# Altium schematic sheet Power-Processor-1-Sheet.SchDoc
size 420 x 297 mm; SheetNumber: 1; SheetTotal: 4
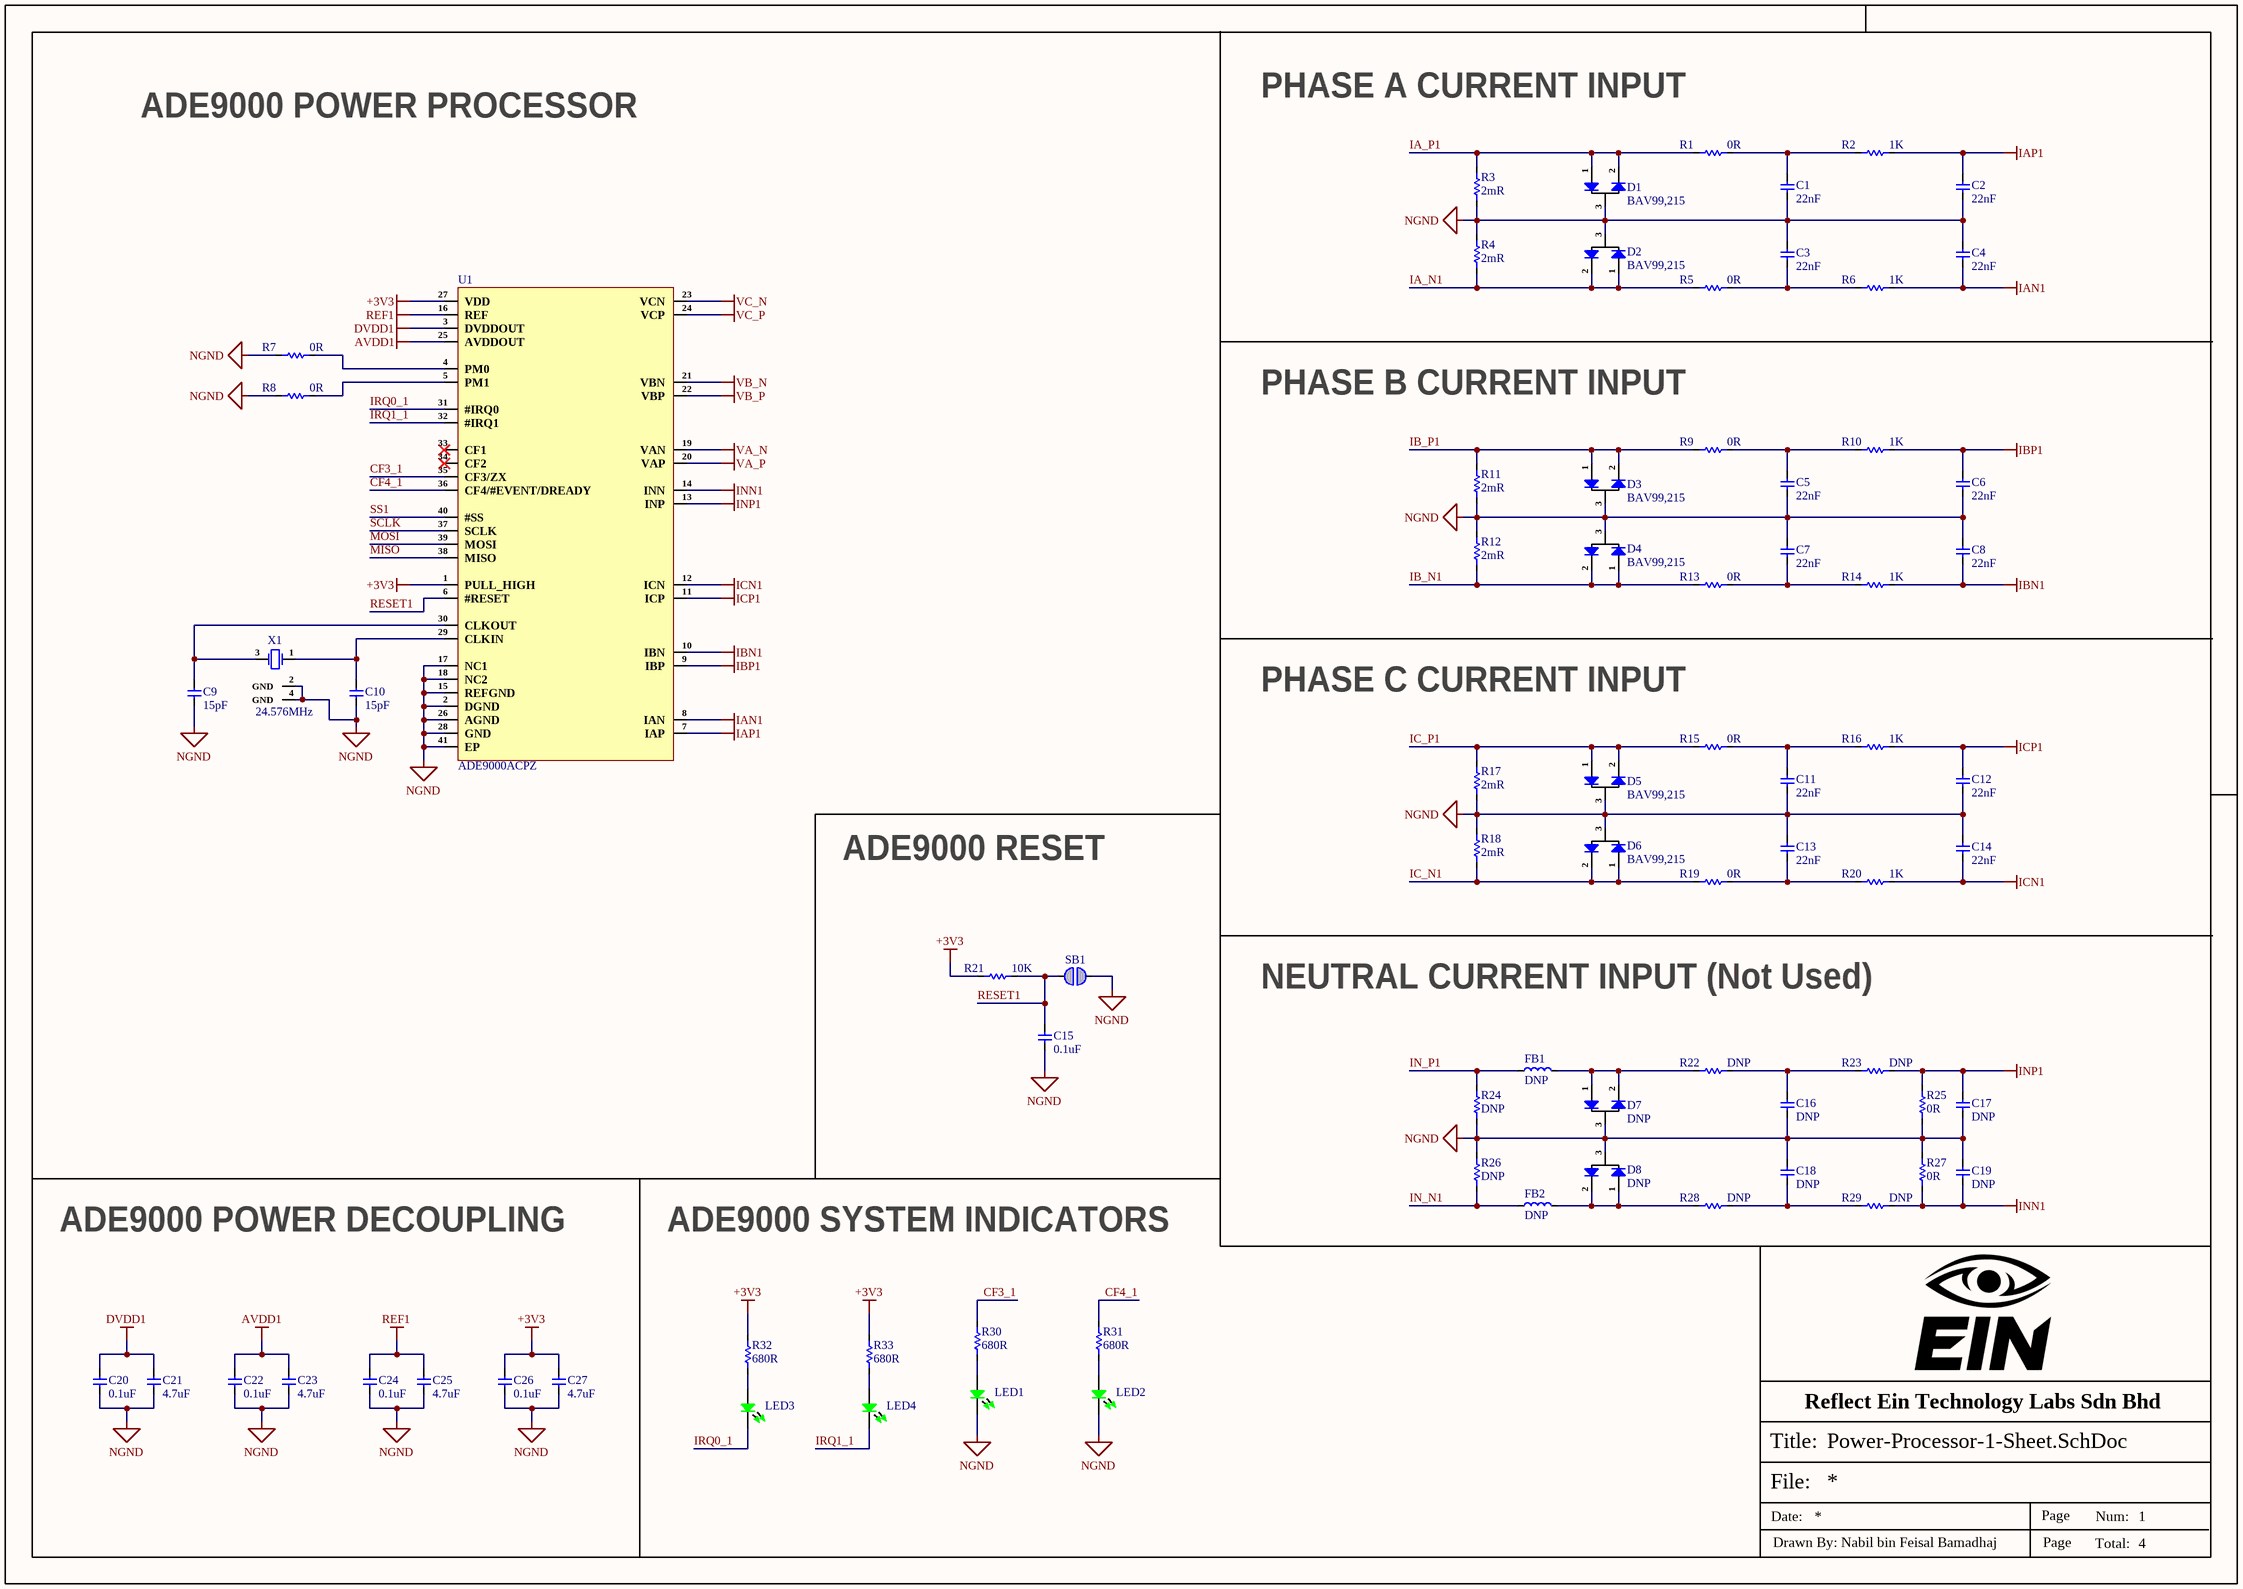
[diagram p0: Power-Processor-1-Sheet.SchDoc]

## Parts
C1  22nF  [Cap-0805]
C2  22nF  [Cap-0805]
C3  22nF  [Cap-0805]
C4  22nF  [Cap-0805]
C5  22nF  [Cap-0805]
C6  22nF  [Cap-0805]
C7  22nF  [Cap-0805]
C8  22nF  [Cap-0805]
C9  15pF  [Cap-0603]
C10  15pF  [Cap-0603]
C11  22nF  [Cap-0805]
C12  22nF  [Cap-0805]
C13  22nF  [Cap-0805]
C14  22nF  [Cap-0805]
C15  0.1uF  [Cap-0603]
C16  DNP  [Cap-0805]  (no BOM)
C17  DNP  [Cap-0805]  (no BOM)
C18  DNP  [Cap-0805]  (no BOM)
C19  DNP  [Cap-0805]  (no BOM)
C20  0.1uF  [Cap-0603]
C21  4.7uF  [Cap-0603]
C22  0.1uF  [Cap-0603]
C23  4.7uF  [Cap-0603]
C24  0.1uF  [Cap-0603]
C25  4.7uF  [Cap-0603]
C26  0.1uF  [Cap-0603]
C27  4.7uF  [Cap-0603]
D1  BAV99,215  [SOT-23]
D2  BAV99,215  [SOT-23]
D3  BAV99,215  [SOT-23]
D4  BAV99,215  [SOT-23]
D5  BAV99,215  [SOT-23]
D6  BAV99,215  [SOT-23]
D7  DNP  [SOT-23]  (no BOM)
D8  DNP  [SOT-23]  (no BOM)
FB1  DNP  [Ind-0805]  (no BOM)
FB2  DNP  [Ind-0805]  (no BOM)
LED1  Emerald  [LED-0603]  (value not drawn)
LED2  Emerald  [LED-0603]  (value not drawn)
LED3  Emerald  [LED-0603]  (value not drawn)
LED4  Emerald  [LED-0603]  (value not drawn)
R1  0R  [Res-0603]
R2  1K  [Res-0603]
R3  2mR  [RES-2512]
R4  2mR  [RES-2512]
R5  0R  [Res-0603]
R6  1K  [Res-0603]
R7  0R  [Res-0603]
R8  0R  [Res-0603]
R9  0R  [Res-0603]
R10  1K  [Res-0603]
R11  2mR  [RES-2512]
R12  2mR  [RES-2512]
R13  0R  [Res-0603]
R14  1K  [Res-0603]
R15  0R  [Res-0603]
R16  1K  [Res-0603]
R17  2mR  [RES-2512]
R18  2mR  [RES-2512]
R19  0R  [Res-0603]
R20  1K  [Res-0603]
R21  10K  [Res-0603]
R22  DNP  [Res-0603]  (no BOM)
R23  DNP  [Res-0603]  (no BOM)
R24  DNP  [RES-2512]  (no BOM)
R25  0R  [Res-0603]
R26  DNP  [RES-2512]  (no BOM)
R27  0R  [Res-0603]
R28  DNP  [Res-0603]  (no BOM)
R29  DNP  [Res-0603]  (no BOM)
R30  680R  [Res-0603]
R31  680R  [Res-0603]
R32  680R  [Res-0603]
R33  680R  [Res-0603]
SB1  Solder Bridge 0603  [Solder Bridge]  (value not drawn)  (no BOM)
U1  ADE9000ACPZ  [40-LFCSP-WQ (6x6)]
X1  24.576MHz  [SMD3225-4P]

## Nets
+3V3: C26.2 C27.2 R21.1 R32.2 R33.2 U1.1(PULL_HIGH) U1.27(VDD)
AVDD1: C22.2 C23.2 U1.25(AVDDOUT)
DVDD1: C20.2 C21.2 U1.3(DVDDOUT)
IAN1: C4.1 R6.2 U1.8(IAN)
IAP1: C2.2 R2.2 U1.7(IAP)
IBN1: C8.1 R14.2 U1.10(IBN)
IBP1: C6.2 R10.2 U1.9(IBP)
ICN1: C14.1 R20.2 U1.12(ICN)
ICP1: C12.2 R16.2 U1.11(ICP)
INN1: C19.1 R27.1 R29.2 U1.14(INN)
INP1: C17.2 R23.2 R25.2 U1.13(INP)
NGND: C1.1 C2.1 C3.2 C4.2 C5.1 C6.1 C7.2 C8.2 C9.1 C10.1 C11.1 C12.1 C13.2 C14.2 C15.1 C16.1 C17.1 C18.2 C19.2 C20.1 C21.1 C22.1 C23.1 C24.1 C25.1 C26.1 C27.1 D1.3 D2.3 D3.3 D4.3 D5.3 D6.3 D7.3 D8.3 LED1.2 LED2.2 R3.1 R4.2 R7.1 R8.1 R11.1 R12.2 R17.1 R18.2 R24.1 R25.1 R26.2 R27.2 SB1.1 U1.2(DGND) U1.15(REFGND) U1.17(NC1) U1.18(NC2) U1.26(AGND) U1.28(GND) U1.41(EP) X1.2(GND) X1.4(GND)
REF1: C24.2 C25.2 U1.16(REF)
VA_N: U1.19(VAN)
VA_P: U1.20(VAP)
VB_N: U1.21(VBN)
VB_P: U1.22(VBP)
VC_N: U1.23(VCN)
VC_P: U1.24(VCP)
CF3_1: R30.2 U1.35(CF3/ZX)
CF4_1: R31.2 U1.36(CF4/#EVENT/DREADY)
IA_N1: D2.1 D2.2 R4.1 R5.1
IA_P1: D1.1 D1.2 R1.1 R3.2
IB_N1: D4.1 D4.2 R12.1 R13.1
IB_P1: D3.1 D3.2 R9.1 R11.2
IC_N1: D6.1 D6.2 R18.1 R19.1
IC_P1: D5.1 D5.2 R15.1 R17.2
IN_N1: FB2.1 R26.1
IN_P1: FB1.1 R24.2
IRQ0_1: LED3.2 U1.31(#IRQ0)
IRQ1_1: LED4.2 U1.32(#IRQ1)
MISO: U1.38(MISO)
MOSI: U1.39(MOSI)
RESET1: C15.2 R21.2 SB1.2 U1.6(#RESET)
SCLK: U1.37(SCLK)
SS1: U1.40(#SS)
NetC1_2: C1.2 R1.2 R2.1
NetC3_1: C3.1 R5.2 R6.1
NetC5_2: C5.2 R9.2 R10.1
NetC7_1: C7.1 R13.2 R14.1
NetC9_2: C9.2 U1.30(CLKOUT) X1.3(CRYSTAL)
NetC10_2: C10.2 U1.29(CLKIN) X1.1(CRYSTAL)
NetC11_2: C11.2 R15.2 R16.1
NetC13_1: C13.1 R19.2 R20.1
NetC16_2: C16.2 R22.2 R23.1
NetC18_1: C18.1 R28.2 R29.1
NetD7_1: D7.1 D7.2 FB1.2 R22.1
NetD8_1: D8.1 D8.2 FB2.2 R28.1
NetLED1_1: LED1.1 R30.1
NetLED2_1: LED2.1 R31.1
NetLED3_1: LED3.1 R32.1
NetLED4_1: LED4.1 R33.1
NetR7_2: R7.2 U1.4(PM0)
NetR8_2: R8.2 U1.5(PM1)

Not connected (* = marked no-connect by the designer): U1 33(CF1)* 34(CF2)*

## Notes on the sheet
- ADE9000 POWER PROCESSOR
- PHASE A CURRENT INPUT
- PHASE B CURRENT INPUT
- PHASE C CURRENT INPUT
- ADE9000 RESET
- NEUTRAL CURRENT INPUT (Not Used)
- ADE9000 POWER DECOUPLING
- ADE9000 SYSTEM INDICATORS
- Reflect Ein Technology Labs Sdn Bhd
- File:
- Title:
- Date:
- Page
- Num:
- Total:
- Drawn By: Nabil bin Feisal Bamadhaj

## Library data of the parts
C1-C8 C11-C14 C16-C19 = GRM21B5C1H223JA01L: CAP CER 0.022UF 50V C0G/NP0 0805; Manufacturer: Murata; Item Type: Capacitors; Supplier: Mouser; LCSC Part Number: C77069; Manufacturer Part Number: GRM21B5C1H223JA01L; RoHS: Yes; Stock: 33939; Pricing: 1=0.38, 10=0.162, 50=0.162, 100=0.108, 1000=0.089, 10000=0.065 (USD); Lead Free: 5697LeadFree; ComponentLink1URL: https://datasheet.ciiva.com/29042/1858738-29042965.pdf?src-supplier=Jameco; ComponentLink1Description: https://datasheet.ciiva.com/29042/1858738-29042965.pdf?src-supplier=Jameco; ComponentLink2URL: https://datasheet.ciiva.com/2989/product-2989681.pdf?src-supplier=Avnet; ComponentLink2Description: https://datasheet.ciiva.com/2989/product-2989681.pdf?src-supplier=Avnet; ComponentLink3URL: https://datasheet.ciiva.com/3777/99grm21b5c1h223ja0123-3777023.pdf?src-supplier=Arrow+Electronics; ComponentLink3Description: https://datasheet.ciiva.com/3777/99grm21b5c1h223ja0123-3777023.pdf?src-supplier=Arrow+Electronics; ComponentLink4URL: https://datasheet.ciiva.com/29200/453051-da-01-en-vs-kondensator-0805-29200670.pdf?src-supplier=Conrad; ComponentLink4Description: https://datasheet.ciiva.com/29200/453051-da-01-en-vs-kondensator-0805-29200670.pdf?src-supplier=Conrad; ComponentLink5URL: https://datasheet.ciiva.com/138/partnumbering-e-01-138787.pdf?src-supplier=Digikey; ComponentLink5Description: https://datasheet.ciiva.com/138/partnumbering-e-01-138787.pdf?src-supplier=Digikey; ComponentLink6URL: https://datasheet.ciiva.com/138/partnumbering-e-01-138788.pdf?src-supplier=Digikey; ComponentLink6Description: https://datasheet.ciiva.com/138/partnumbering-e-01-138788.pdf?src-supplier=Digikey; ComponentLink7URL: https://datasheet.ciiva.com/138/partnumbering-e-01-138789.pdf?src-supplier=Digikey; ComponentLink7Description: https://datasheet.ciiva.com/138/partnumbering-e-01-138789.pdf?src-supplier=Digikey; ComponentLink8URL: https://datasheet.ciiva.com/22703/608985-22703464.pdf?src-supplier=Element14; ComponentLink8Description: https://datasheet.ciiva.com/22703/608985-22703464.pdf?src-supplier=Element14; ComponentLink9URL: https://datasheet.ciiva.com/7828/608985-7828990.pdf?src-supplier=Element14; ComponentLink9Description: https://datasheet.ciiva.com/7828/608985-7828990.pdf?src-supplier=Element14
C9 C10 = CC0603JRNPO9BN150: CAP CER 15PF 50V C0G/NPO 0603; Manufacturer: Yageo; Dielectric Material: Ceramic; Tolerance: 5%; Dielectric: C0G; Insulation Resistance: 100GR; Item Type: Capacitor; Supplier 1: Future Electronics; Manufacturer Part Number: CC0603JRNPO9BN150; RoHS: Yes; Category: Ceramic Capacitors; Stock 1: 832000; Pricing 1: 4000=0.0038, 16000=0.0036, 80000=0.0034, 160000=0.0033, 500000=0.0031 (USD); Mounting Technology: Surface Mount; Case/Package: 0603; Pins: 2; Case Code (Metric): 1608; Case Code (Imperial): 0603; Min Operating Temperature: -55°C; Max Operating Temperature: 125°C; Value: 15pF; Series: CC; Packaging: Tape and Reel; Package Quantity: 1; Termination: SMD/SMT; Voltage Rating: 50V; Length: 1.6mm; Width: 0.031inch; Height: 0.8mm; Depth: 0.8mm; Thickness: 0.035inch; Radiation Hardening: No; RoHS Compliant: Yes; Reach SVHC Compliant: No; Lead Free: Lead Free; ComponentLink1URL: https://datasheet.ciiva.com/144/mlccorderingcode-144635.pdf?src-supplier=Digi-Key; ComponentLink1Description: https://datasheet.ciiva.com/144/mlccorderingcode-144635.pdf?src-supplier=Digi-Key; ComponentLink2URL: https://datasheet.ciiva.com/144/mlccorderingcode-144636.pdf?src-supplier=Digi-Key; ComponentLink2Description: https://datasheet.ciiva.com/144/mlccorderingcode-144636.pdf?src-supplier=Digi-Key; ComponentLink3URL: https://datasheet.ciiva.com/8033/1443161-8033721.pdf?src-supplier=Element14; ComponentLink3Description: https://datasheet.ciiva.com/8033/1443161-8033721.pdf?src-supplier=Element14; ComponentLink4URL: https://datasheet.ciiva.com/28450/1443161-28450472.pdf?src-supplier=Element14; ComponentLink4Description: https://datasheet.ciiva.com/28450/1443161-28450472.pdf?src-supplier=Element14; ComponentLink5URL: https://datasheet.ciiva.com/144/mlccorderingcode-144634.pdf?src-supplier=Digi-Key; ComponentLink5Description: https://datasheet.ciiva.com/144/mlccorderingcode-144634.pdf?src-supplier=Digi-Key; ComponentLink6URL: https://datasheet.ciiva.com/8033/1734582-8033723.pdf?src-supplier=Element14; ComponentLink6Description: https://datasheet.ciiva.com/8033/1734582-8033723.pdf?src-supplier=Element14; ComponentLink7URL: https://datasheet.ciiva.com/8033/1734582-8033722.pdf?src-supplier=Element14; ComponentLink7Description: https://datasheet.ciiva.com/8033/1734582-8033722.pdf?src-supplier=Element14; ComponentLink8URL: https://datasheet.ciiva.com/11464/upy-gp-np0-16v-to-50v-8-11464727.pdf?src-supplier=Avnet; ComponentLink8Description: https://datasheet.ciiva.com/11464/upy-gp-np0-16v-to-50v-8-11464727.pdf?src-supplier=Avnet; Supplier Part Number 1: 4234670; LCSC Part Number: C107037
C15 C20 C22 C24 C26 = GCJ188R71H104KA12D: CAP CER 0.1UF 50V X7R 0603; Manufacturer: Murata; Item Type: Capacitors; Material: 4241ConductorMaterial; Value: 100nF; Tolerance: 10%; Supplier: Mouser; LCSC Part Number: C161115; Manufacturer Part Number: GCJ188R71H104KA12D; RoHS: Yes; Stock: 342536; Pricing: 1=0.13, 10=0.056, 50=0.056, 100=0.036, 1000=0.032, 10000=0.02 (USD); Mounting Technology: Surface Mount; Case/Package: 0603; Case Code (Metric): 1608; Case Code (Imperial): 0603; Min Operating Temperature: -55°C; Max Operating Temperature: 125°C; Dielectric: X7R; Package Quantity: 1; Voltage Rating: 50V; Packaging: Tape and Reel; Voltage Rating (DC): 50V; Termination: SMD/SMT; Features: Soft Termination; Series: GCJ; Construction: Flat; Length: 1.6mm; Width: 0.031inch; Height: 0.8mm; Thickness: 0.035inch; Depth: 0.8mm; Ratings: AEC-Q200; Radiation Hardening: No; RoHS Compliant: Yes; Lead Free: 5697LeadFree; ComponentLink1URL: https://datasheet.ciiva.com/135/product-135604.pdf?src-supplier=Digikey; ComponentLink1Description: https://datasheet.ciiva.com/135/product-135604.pdf?src-supplier=Digikey; ComponentLink2URL: https://datasheet.ciiva.com/26889/getdatasheetpartid-369886-26889118.pdf?src-supplier=Verical; ComponentLink2Description: https://datasheet.ciiva.com/26889/getdatasheetpartid-369886-26889118.pdf?src-supplier=Verical; ComponentLink3URL: https://datasheet.ciiva.com/135/s0717e-135605.pdf?src-supplier=Digikey; ComponentLink3Description: https://datasheet.ciiva.com/135/s0717e-135605.pdf?src-supplier=Digikey; ComponentLink4URL: https://datasheet.ciiva.com/135/s0717e-135606.pdf?src-supplier=Digikey; ComponentLink4Description: https://datasheet.ciiva.com/135/s0717e-135606.pdf?src-supplier=Digikey; ComponentLink5URL: https://datasheet.ciiva.com/16440/c03e-16440425.pdf?src-supplier=Future+Electronics; ComponentLink5Description: https://datasheet.ciiva.com/16440/c03e-16440425.pdf?src-supplier=Future+Electronics
C21 C23 C25 C27 = GRM188Z71A475KE15D: CAP CER 4.7UF 10V X7R 0603; Manufacturer: Murata; Item Type: Capacitors; Material: 4241ConductorMaterial; Tolerance: 10%; Supplier: Mouser; LCSC Part Number: C913474; Manufacturer Part Number: GRM188Z71A475KE15D; RoHS: Yes; Stock: 33218; Pricing: 1=0.24, 10=0.1, 50=0.1, 100=0.063, 1000=0.055, 10000=0.041 (USD); Case/Package: 0603; Min Operating Temperature: -55°C; Max Operating Temperature: 125°C; Value: 4.7uF; Voltage Rating: 10V; Length: 1.6mm; Width: 800um; Height: 950um; Thickness: 800um; RoHS Compliant: Yes; ComponentLink1URL: https://datasheet.octopart.com/GRM188Z71A475KE15D-Murata-datasheet-149523299.pdf?src-supplier=Newark; ComponentLink1Description: https://datasheet.octopart.com/GRM188Z71A475KE15D-Murata-datasheet-149523299.pdf?src-supplier=Newark; ComponentLink2URL: https://datasheet.octopart.com/GRM188Z71A475KE15D-Murata-datasheet-165579666.pdf?src-supplier=TME; ComponentLink2Description: https://datasheet.octopart.com/GRM188Z71A475KE15D-Murata-datasheet-165579666.pdf?src-supplier=TME
D1-D8 = BAV99,215: DIODE ARR GP 100V 215MA TO-236AB; Manufacturer: Nexperia; Item Type: Diodes; Forward Voltage: 1.25V; Breakdown Voltage: 75V; Forward Current: 125mA; Max Forward Surge Current (Ifsm): 500mA; Max Reverse Current: 500nA; Value: 1.5pF; Supplier: Future Electronics; LCSC Part Number: C2500; Manufacturer Part Number: BAV99,215; RoHS: Yes; Stock: 20217000; Pricing: 3000=0.008, 12000=0.0077, 30000=0.0075, 75000=0.0073, 120000=0.007 (USD); Pins: 3NUMBER; Max Operating Temperature: 150°C; Max Repetitive Reverse Voltage (Vrrm): 100V; Reverse Voltage: 100V; Height: 1.1mm; RoHS Compliant: Yes; ComponentLink1URL: http://www.farnell.com/datasheets/953882.pdf?src-supplier=Farnell; ComponentLink1Description: http://www.farnell.com/datasheets/953882.pdf?src-supplier=Farnell; ComponentLink2URL: http://www.farnell.com/datasheets/953882.pdf?src-supplier=Newark; ComponentLink2Description: http://www.farnell.com/datasheets/953882.pdf?src-supplier=Newark; ComponentLink3URL: https://datasheet.octopart.com/BAV99%2C215-Nexperia-datasheet-10109661.pdf?src-supplier=Element14; ComponentLink3Description: https://datasheet.octopart.com/BAV99%2C215-Nexperia-datasheet-10109661.pdf?src-supplier=Element14; ComponentLink4URL: https://assets.nexperia.com/documents/data-sheet/BAV99_SER.pdf?src-supplier=Digikey; ComponentLink4Description: https://assets.nexperia.com/documents/data-sheet/BAV99_SER.pdf?src-supplier=Digikey; ComponentLink5URL: https://datasheet.octopart.com/BAV99%2C215-Nexperia-datasheet-87580883.pdf?src-supplier=Newark; ComponentLink5Description: https://datasheet.octopart.com/BAV99%2C215-Nexperia-datasheet-87580883.pdf?src-supplier=Newark
FB1 FB2 = BLM21BD152SN1D: FERRITE BEAD 1.5 KOHM 0805 1LN; Manufacturer: Murata; Item Type: Ferrite Beads; RMS Current (Irms): 250mA; ESR: 450mR; Shielding: 202Shielding; Frequency: 100MHz; Number of Circuits: 1NUMBER; Supplier: Mouser; LCSC Part Number: C413959; Manufacturer Part Number: BLM21BD152SN1D; RoHS: Yes; Stock: 31999; Pricing: 1=0.21, 10=0.114, 50=0.114, 100=0.102, 1000=0.068, 10000=0.048 (USD); Lead Free: 5697LeadFree; ComponentLink1URL: https://datasheet.ciiva.com/19454/1845267-19454720.pdf?src-supplier=Jameco; ComponentLink1Description: https://datasheet.ciiva.com/19454/1845267-19454720.pdf?src-supplier=Jameco; ComponentLink2URL: https://datasheet.ciiva.com/14122/amblm21b-data-e-14122891.pdf?src-supplier=Distrelec; ComponentLink2Description: https://datasheet.ciiva.com/14122/amblm21b-data-e-14122891.pdf?src-supplier=Distrelec; ComponentLink3URL: https://datasheet.ciiva.com/6211/l0110s0100blm21b-6211484.pdf?src-supplier=Digikey; ComponentLink3Description: https://datasheet.ciiva.com/6211/l0110s0100blm21b-6211484.pdf?src-supplier=Digikey; ComponentLink4URL: https://datasheet.ciiva.com/6211/l0110s0100blm21b-6211486.pdf?src-supplier=Digikey; ComponentLink4Description: https://datasheet.ciiva.com/6211/l0110s0100blm21b-6211486.pdf?src-supplier=Digikey; ComponentLink5URL: https://datasheet.ciiva.com/6211/l0110s0100blm21b-6211487.pdf?src-supplier=Digikey; ComponentLink5Description: https://datasheet.ciiva.com/6211/l0110s0100blm21b-6211487.pdf?src-supplier=Digikey; ComponentLink6URL: https://datasheet.ciiva.com/16420/l0110s0100blm21b-16420715.pdf?src-supplier=Future+Electronics; ComponentLink6Description: https://datasheet.ciiva.com/16420/l0110s0100blm21b-16420715.pdf?src-supplier=Future+Electronics; ComponentLink7URL: https://datasheet.ciiva.com/17277/l0110s0100blm21b-17277370.pdf?; ComponentLink7Description: https://datasheet.ciiva.com/17277/l0110s0100blm21b-17277370.pdf?
LED1-LED4 = NCD0603G2: Emerald 0603 Light Emitting Diodes (LED) ROHS; Manufacturer: Foshan NationStar Optoelectronics; Manufacturer Part Number: NCD0603G2; Package: 0603; LCSC Part Number: C87326; Item Type: LED; ComponentLink1Description: LCSC; ComponentLink1URL: https://www.lcsc.com/product-detail/Light-Emitting-Diodes-LED_Foshan-NationStar-Optoelectronics-NCD0603G2_C87326.html
R1 R5 R7-R9 R13 R15 R19 R22 R25 R27 R28 = RC0603FR-070RL: RES SMD 0R, 1%, 0.1W, 0603; Manufacturer: Yageo; Item Type: Resistor; Manufacturer Part Number: RC0603FR-070RL; Package: 0603; LCSC Part Number: C100044; ComponentLink9Description: LCSC; ComponentLink9URL: https://www.lcsc.com/product-detail/Chip-Resistor-Surface-Mount_YAGEO-RC0603FR-070RL_C100044.html
R2 R6 R10 R14 R16 R20 R23 R29 = RC0603FR-071KL: RES SMD 1K OHM 1% 1/10W 0603; Manufacturer: Yageo; Resistance: 1kR; Temperature Coefficient: 100ppm/°C; Power Rating: 100mW; Voltage Rating: 50V; Item type: Resistor; ComponentLink1URL: https://www.verical.com/server-webapp/html/getDatasheet?partID=409289&src-supplier=Verical; ComponentLink1Description: https://www.verical.com/server-webapp/html/getDatasheet?partID=409289&src-supplier=Verical; Supplier 1: Digi-Key; Manufacturer Part Number: RC0603FR-071KL; Stock 1: 21472395; Pricing 1: 1=0.1, 10=0.023, 100=0.0094, 1000=0.0042, 2500=0.0037 (USD); Case/Package: 0603; Contact Plating: Tin,Matte; Case Code (Imperial): 0603; Case Code (Metric): 1608; Min Operating Temperature: -55°C; Max Operating Temperature: 155°C; Tolerance: 1%; Composition: Thick Film; Packaging: Tape and Reel; Termination: SMD/SMT; Military Standard: Not; Length: 1.6mm; Height: 0.45mm; Depth: 0.8mm; Radiation Hardening: No; REACH SVHC: No SVHC; Lead Free: Lead Free; ComponentLink2URL: http://documents.rs-components.com/techlib://itc_doclist_GB.htm?stockno=5048928&src-supplier=RSComponents; ComponentLink2Description: http://documents.rs-components.com/techlib://itc_doclist_GB.htm?stockno=5048928&src-supplier=RSComponents; ComponentLink3URL: http://www.yageo.com/documents/recent/PYu-RC0603_51_RoHS_L_4.pdf?src-supplier=Avnet+Europe; ComponentLink3Description: http://www.yageo.com/documents/recent/PYu-RC0603_51_RoHS_L_4.pdf?src-supplier=Avnet+Europe; ComponentLink4URL: http://www.farnell.com/datasheets/2167052.pdf?src-supplier=Element14; ComponentLink4Description: http://www.farnell.com/datasheets/2167052.pdf?src-supplier=Element14; ComponentLink5URL: http://www.farnell.com/datasheets/1868787.pdf?src-supplier=Element14; ComponentLink5Description: http://www.farnell.com/datasheets/1868787.pdf?src-supplier=Element14; ComponentLink6URL: http://www.yageo.com/documents/recent/PYu-RC_Group_51_RoHS_L_2.pdf?src-supplier=Avnet; ComponentLink6Description: http://www.yageo.com/documents/recent/PYu-RC_Group_51_RoHS_L_2.pdf?src-supplier=Avnet; ComponentLink7URL: https://www.verical.com/server-webapp/html/getDatasheet?partID=404327&src-supplier=Verical; ComponentLink7Description: https://www.verical.com/server-webapp/html/getDatasheet?partID=404327&src-supplier=Verical; ComponentLink8URL: http://www.farnell.com/datasheets/443971.pdf?src-supplier=Element14; ComponentLink8Description: http://www.farnell.com/datasheets/443971.pdf?src-supplier=Element14; Supplier Part Number 1: 311-1.00KHRDKR-ND; LCSC Part Number: C22548
R3 R4 R11 R12 R17 R18 R24 R26 = PA2512FKE7T0R002E: RES 0.002 OHM 1% 3W 2512; Manufacturer: Yageo; Item Type: Resistors; Supplier: Digikey; LCSC Part Number: C375692; Manufacturer Part Number: PA2512FKE7T0R002E; RoHS: Yes; Stock: 3531; Pricing: 1=0.87, 10=0.754, 25=0.662, 50=0.5936, 100=0.5253, 250=0.45696, 500=0.37944, 1000=0.31212 (USD)
R21 = RC0603FR-0710KL: RES SMD 10K Ohm 1% 1/10W 0603; Manufacturer: Yageo; Resistance: 10kR; Temperature Coefficient: 100ppm/°C; Voltage Rating (DC): 50V; Power Rating: 100mW; Voltage Rating: 75V; Item Type: Resistor; Supplier 1: Digi-Key; Manufacturer Part Number: RC0603FR-0710KL; RoHS: Yes; Category: Chip SMD Resistors; Stock 1: 25249139; Pricing 1: 1=0.10000, 10=0.02400, 100=0.00970, 1000=0.00436, 2500=0.00378 (USD); Case/Package: 0603; Number of Pins: 2; Case Code (Imperial): 0603; Case Code (Metric): 1608; Weight: 7.1E-05oz; Size Code: 0603; Min Operating Temperature: -55°C; Max Operating Temperature: 155°C; Tolerance: 1%; Resistor Type: Thick Film; Packaging: Tape and Reel; Termination: SMD/SMT; Features: Moisture Resistant; Series: RC; Max Power Dissipation: 100mW; Number of Terminations: 2; Resistance Tolerance: 1%; Construction: Rectangular; Length: 1.6mm; Width: 0.8mm; Height: 0.45mm; Depth: 0.8mm; Lead Pitch: 0.3mm; REACH SVHC: Unknown; Lead Free: Lead Free; Military Standard: Not; RoHS Compliant: Yes; ComponentLink1URL: https://datasheet.ciiva.com/7660/38590-7660789.pdf?src-supplier=Element14; ComponentLink1Description: https://datasheet.ciiva.com/7660/38590-7660789.pdf?src-supplier=Element14; ComponentLink2URL: https://datasheet.ciiva.com/7983/443971-7983596.pdf?src-supplier=Element14; ComponentLink2Description: https://datasheet.ciiva.com/7983/443971-7983596.pdf?src-supplier=Element14; ComponentLink3URL: https://datasheet.ciiva.com/22747/443971-22747519.pdf?src-supplier=Element14; ComponentLink3Description: https://datasheet.ciiva.com/22747/443971-22747519.pdf?src-supplier=Element14; ComponentLink4URL: https://datasheet.ciiva.com/46440/1868787-46440891.pdf?src-supplier=Element14; ComponentLink4Description: https://datasheet.ciiva.com/46440/1868787-46440891.pdf?src-supplier=Element14; ComponentLink5URL: https://datasheet.ciiva.com/7746/1738695-7746239.pdf?src-supplier=Element14; ComponentLink5Description: https://datasheet.ciiva.com/7746/1738695-7746239.pdf?src-supplier=Element14; ComponentLink6URL: https://datasheet.ciiva.com/15189/getdatasheetpartid-409289-15189591.pdf?src-supplier=Verical; ComponentLink6Description: https://datasheet.ciiva.com/15189/getdatasheetpartid-409289-15189591.pdf?src-supplier=Verical; Supplier Part Number 1: 311-10.0KHRCT-ND; LCSC Part Number: C98220
R30-R33 = RC0603FR-07680RL: RES SMD 680 OHM 1% 1/10W 0603; Manufacturer: Yageo; Item Type: Resistor; Manufacturer Part Number: RC0603FR-07680RL; Package: 0603; ComponentLink4URL: https://www.lcsc.com/product-detail/Chip-Resistor-Surface-Mount_YAGEO-RC0603FR-07680RL_C112310.html; ComponentLink4Description: LCSC; LCSC Part Number: C112310
SB1 = Solder Bridge 0603: Solder Bridge ON; Manufacturer Part Number: Solder Bridge; Item Type: Solder Bridge
U1 = ADE9000ACPZ: IC AFE 7 CHAN 40LFCSP-WQ; Manufacturer: Analog Devices; Supplier: Mouser; Supplier Part Number: 584-ADE9000ACPZ; Manufacturer Part Number: ADE9000ACPZ; RoHS: Yes; Item Type: IC; Stock: 7889; Pricing: 1=18.44, 10=13.35, 50=10.79, 100=10.79, 1000=10.52, 10000=10.52 (USD); ComponentLink1URL: http://www.farnell.com/datasheets/2280571.pdf?src-supplier=Farnell; ComponentLink1Description: http://www.farnell.com/datasheets/2280571.pdf?src-supplier=Farnell; ComponentLink2URL: https://datasheet.octopart.com/ADE9000ACPZ-Analog-Devices-datasheet-165826959.pdf?src-supplier=Element14; ComponentLink2Description: https://datasheet.octopart.com/ADE9000ACPZ-Analog-Devices-datasheet-165826959.pdf?src-supplier=Element14; ComponentLink3URL: https://www.analog.com/media/en/technical-documentation/data-sheets/ADE9000.pdf?src-supplier=Digikey; ComponentLink3Description: https://www.analog.com/media/en/technical-documentation/data-sheets/ADE9000.pdf?src-supplier=Digikey
X1 = X322524576MOB4SI: 24.576MHz Surface Mount Crystal 12pF ±10ppm ±20ppm SMD3225-4P Crystals ROHS; Manufacturer: YXC; Supplier: LCSC; LCSC Part Number: C70568; Manufacturer Part Number: X322524576MOB4SI; RoHS: No; Item Type: Crystal; ComponentLink1Description: LCSC; ComponentLink1URL: https://www.lcsc.com/product-detail/Crystals_YXC-Crystal-Oscillators-X322524576MOB4SI_C70568.html?s_z=n_X322524576MOB4SI